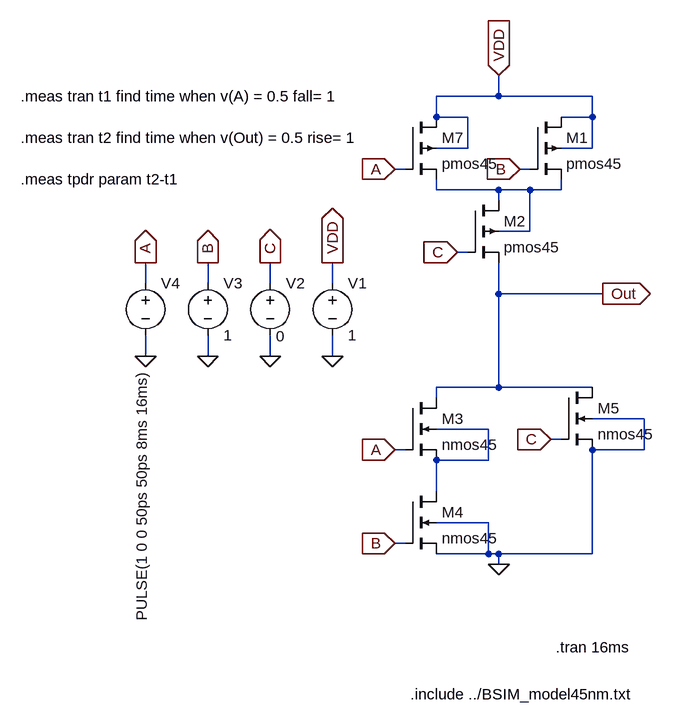
[diagram p0: schematic ( Uge 7 ) - Exercise 2.asc]
( Uge 7 ) - Exercise 2.asc, the LTspice schematic file:
Version 4
SHEET 1 880 1160
WIRE 352 224 352 192
WIRE 352 224 256 224
WIRE 496 224 352 224
WIRE 256 256 256 224
WIRE 304 256 256 256
WIRE 496 256 496 224
WIRE 496 256 448 256
WIRE 304 304 304 256
WIRE 304 304 256 304
WIRE 496 304 496 256
WIRE 496 304 448 304
WIRE 208 336 192 336
WIRE 400 336 384 336
WIRE 256 368 256 352
WIRE 352 368 256 368
WIRE 400 368 352 368
WIRE 448 368 448 352
WIRE 448 368 400 368
WIRE 352 384 352 368
WIRE 400 432 400 368
WIRE 400 432 352 432
WIRE 304 464 288 464
WIRE -192 512 -192 480
WIRE -96 512 -96 480
WIRE 0 512 0 480
WIRE 96 512 96 480
WIRE 352 528 352 480
WIRE 512 528 352 528
WIRE -192 624 -192 592
WIRE -96 624 -96 592
WIRE 0 624 0 592
WIRE 96 624 96 592
WIRE 352 672 352 528
WIRE 352 672 256 672
WIRE 496 672 352 672
WIRE 256 688 256 672
WIRE 576 720 496 720
WIRE 336 736 256 736
WIRE 448 752 432 752
WIRE 208 768 192 768
WIRE 576 768 576 720
WIRE 576 768 496 768
WIRE 336 784 336 736
WIRE 336 784 256 784
WIRE 256 832 256 784
WIRE 336 880 256 880
WIRE 208 912 192 912
WIRE 336 928 336 880
WIRE 336 928 256 928
WIRE 352 928 336 928
WIRE 496 928 496 768
WIRE 496 928 352 928
WIRE 352 944 352 928
FLAG 192 336 A
IOPIN 192 336 In
FLAG 384 336 B
IOPIN 384 336 In
FLAG 512 528 Out
IOPIN 512 528 Out
FLAG 288 464 C
IOPIN 288 464 In
FLAG 352 944 0
FLAG 192 768 A
IOPIN 192 768 In
FLAG 192 912 B
IOPIN 192 912 In
FLAG 432 752 C
IOPIN 432 752 In
FLAG 96 624 0
FLAG 96 480 VDD
IOPIN 96 480 Out
FLAG 0 624 0
FLAG 0 480 C
IOPIN 0 480 Out
FLAG -96 624 0
FLAG -96 480 B
IOPIN -96 480 Out
FLAG -192 624 0
FLAG -192 480 A
IOPIN -192 480 Out
FLAG 352 192 VDD
IOPIN 352 192 In
SYMBOL pmos4 208 256 R0
SYMATTR InstName M7
SYMATTR Value pmos45
SYMATTR Value2 l=60nm w=800nm
SYMBOL pmos4 400 256 R0
SYMATTR InstName M1
SYMATTR Value pmos45
SYMATTR Value2 l=60nm w=800nm
SYMBOL pmos4 304 384 R0
SYMATTR InstName M2
SYMATTR Value pmos45
SYMATTR Value2 l=60nm w=800nm
SYMBOL nmos4 208 688 R0
SYMATTR InstName M3
SYMATTR Value nmos45
SYMATTR Value2 l=60nm w=400nm
SYMBOL nmos4 208 832 R0
SYMATTR InstName M4
SYMATTR Value nmos45
SYMATTR Value2 l=60nm w=400nm
SYMBOL nmos4 448 672 R0
SYMATTR InstName M5
SYMATTR Value nmos45
SYMATTR Value2 l=60nm w=400nm
SYMBOL Voltage 96 496 R0
SYMATTR InstName V1
SYMATTR Value 1
SYMBOL Voltage 0 496 R0
WINDOW 3 9 97 Left 2
SYMATTR InstName V2
SYMATTR Value 0
SYMBOL Voltage -96 496 R0
SYMATTR InstName V3
SYMATTR Value 1
SYMBOL Voltage -192 496 R0
WINDOW 3 -6 535 VLeft 2
SYMATTR InstName V4
SYMATTR Value PULSE(1 0 0 50ps 50ps 8ms 16ms)
TEXT 440 1072 Left 2 !.tran 16ms
TEXT 216 1144 Left 2 !.include ../BSIM_model45nm.txt
TEXT -384 224 Left 2 !.meas tran t1 find time when v(A) = 0.5 fall= 1
TEXT -384 288 Left 2 !.meas tran t2 find time when v(Out) = 0.5 rise= 1
TEXT -384 352 Left 2 !.meas tpdr param t2-t1

The netlist it stands for:
* ( Uge 7 ) - Exercise 2.asc
M7 VDD A N001 VDD pmos45 l=60nm w=800nm
M1 VDD B N001 VDD pmos45 l=60nm w=800nm
M2 N001 C Out N001 pmos45 l=60nm w=800nm
M3 Out A N002 N002 nmos45 l=60nm w=400nm
M4 N002 B 0 0 nmos45 l=60nm w=400nm
M5 Out C 0 0 nmos45 l=60nm w=400nm
V1 VDD 0 1
V2 C 0 0
V3 B 0 1
V4 A 0 PULSE(1 0 0 50ps 50ps 8ms 16ms)
.model NMOS NMOS
.model PMOS PMOS
.lib standard.mos
.tran 16ms
.include ../BSIM_model45nm.txt
.meas tran t1 find time when v(A) = 0.5 fall= 1
.meas tran t2 find time when v(Out) = 0.5 rise= 1
.meas tpdr param t2-t1
.backanno
.end